# Altium project Control_Board_Flex_Cable.PrjPcb
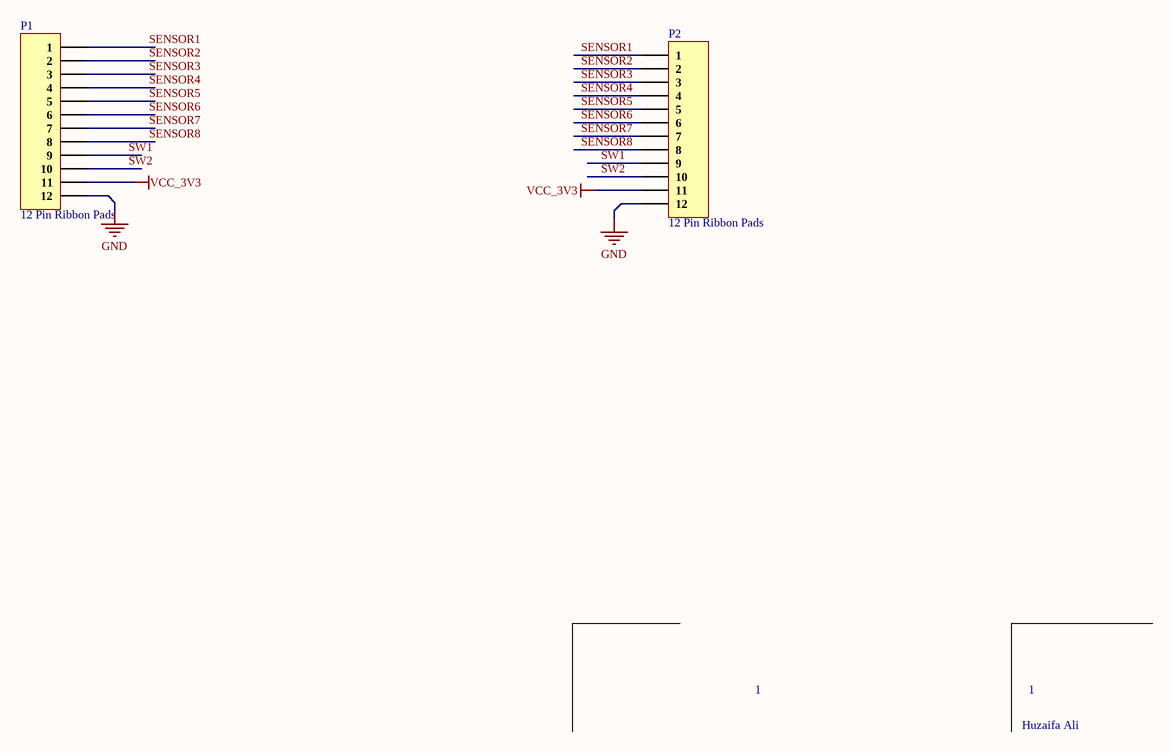
[diagram p0: Main_Sheet.SchDoc]
1 sheet, 2 parts. Net scope: global (net labels, ports and power ports of the same name join across sheets).
Board file: Flex_Cable.PcbDoc

## Sheet Main_Sheet.SchDoc: =Projectname
size A4; SheetNumber: 1; SheetTotal: 1

### Parts
P1  12 Pin Ribbon Pads  [12 Pin Ribbon Pads]
P2  12 Pin Ribbon Pads  [12 Pin Ribbon Pads]

### Nets
GND: P1.12 P2.12
VCC_3V3: P1.11 P2.11
SENSOR1: P1.1 P2.1
SENSOR2: P1.2 P2.2
SENSOR3: P1.3 P2.3
SENSOR4: P1.4 P2.4
SENSOR5: P1.5 P2.5
SENSOR6: P1.6 P2.6
SENSOR7: P1.7 P2.7
SENSOR8: P1.8 P2.8
SW1: P1.9 P2.9
SW2: P1.10 P2.10

### Notes on the sheet
- 1
- Huzaifa Ali

### Library data of the parts
P1 P2 = 12 Pin Ribbon Pads: Ribbon wire Connection Pads